# EAGLE design untitled (EAGLE 9.6.2)
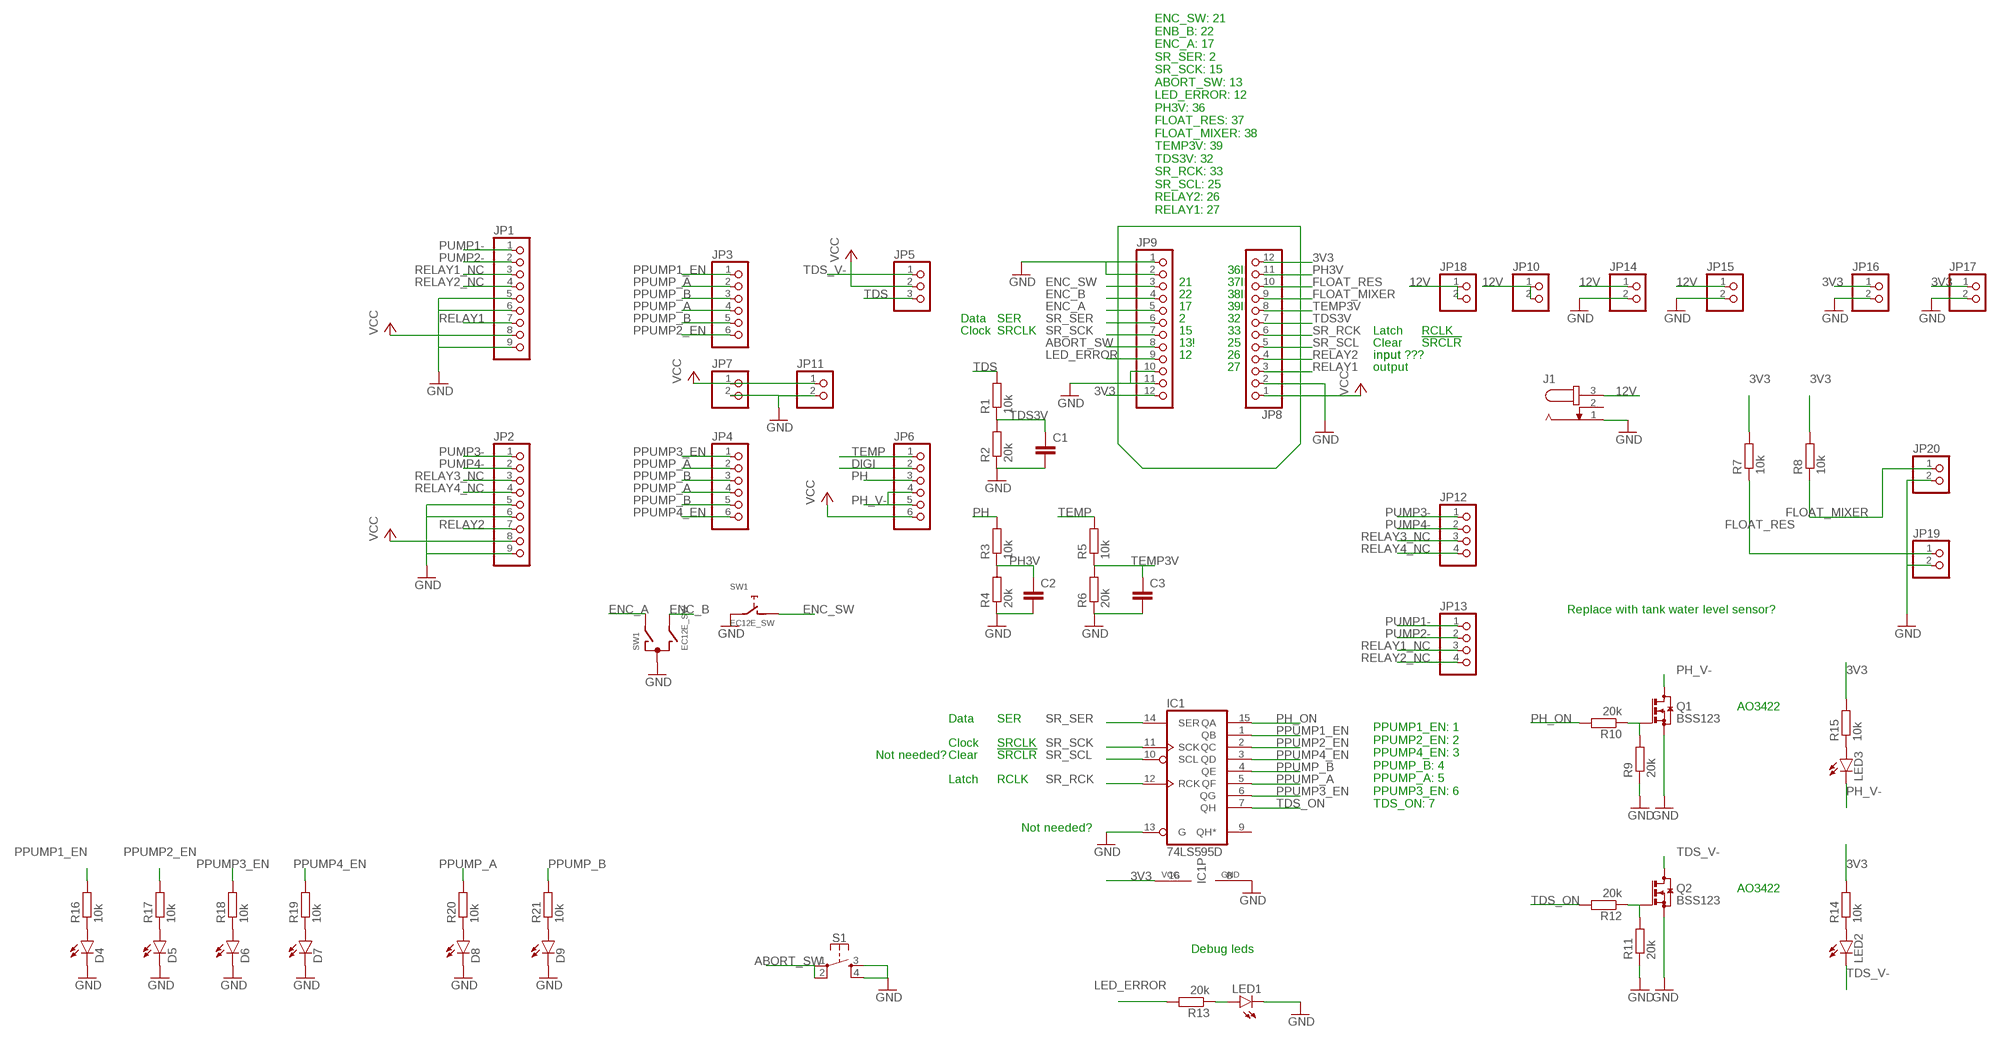
[diagram p0: schematic, sheet 1]

## Parts
C1  C-EUC0805  [C0805]
C2  C-EUC0805  [C0805]
C3  C-EUC0805  [C0805]
D4  LEDCHIP-LED0603  [CHIP-LED0603]
D5  LEDCHIP-LED0603  [CHIP-LED0603]
D6  LEDCHIP-LED0603  [CHIP-LED0603]
D7  LEDCHIP-LED0603  [CHIP-LED0603]
D8  LEDCHIP-LED0603  [CHIP-LED0603]
D9  LEDCHIP-LED0603  [CHIP-LED0603]
IC1  74LS595D  [SO16]
J1  JACK-PLUG1  [SPC4078]
JP1  PINHD-1X9  [1X09]
JP2  PINHD-1X9  [1X09]
JP3  PINHD-1X6  [1X06]
JP4  PINHD-1X6  [1X06]
JP5  PINHD-1X3  [1X03]
JP6  PINHD-1X6  [1X06]
JP7  PINHD-1X2  [1X02]
JP8  PINHD-1X12  [1X12]
JP9  PINHD-1X12  [1X12]
JP10  PINHD-1X2  [1X02]
JP11  PINHD-1X2  [1X02]
JP12  PINHD-1X4  [1X04]
JP13  PINHD-1X4  [1X04]
JP14  PINHD-1X2  [1X02]
JP15  PINHD-1X2  [1X02]
JP16  PINHD-1X2  [1X02]
JP17  PINHD-1X2  [1X02]
JP18  PINHD-1X2  [1X02]
JP19  PINHD-1X2  [1X02]
JP20  PINHD-1X2  [1X02]
LED1  LEDCHIP-LED0603  [CHIP-LED0603]
LED2  LEDCHIP-LED0603  [CHIP-LED0603]
LED3  LEDCHIP-LED0603  [CHIP-LED0603]
Q1  BSS123  [SOT23]
Q2  BSS123  [SOT23]
R1  10k  R-EU_R0805  [R0805]
R2  20k  R-EU_R0805  [R0805]
R3  10k  R-EU_R0805  [R0805]
R4  20k  R-EU_R0805  [R0805]
R5  10k  R-EU_R0805  [R0805]
R6  20k  R-EU_R0805  [R0805]
R7  10k  R-EU_R0805  [R0805]
R8  10k  R-EU_R0805  [R0805]
R9  20k  R-EU_R0805  [R0805]
R10  20k  R-EU_R0805  [R0805]
R11  20k  R-EU_R0805  [R0805]
R12  20k  R-EU_R0805  [R0805]
R13  20k  R-EU_R0805  [R0805]
R14  10k  R-EU_R0805  [R0805]
R15  10k  R-EU_R0805  [R0805]
R16  10k  R-EU_R0805  [R0805]
R17  10k  R-EU_R0805  [R0805]
R18  10k  R-EU_R0805  [R0805]
R19  10k  R-EU_R0805  [R0805]
R20  10k  R-EU_R0805  [R0805]
R21  10k  R-EU_R0805  [R0805]
S1  MOMENTARY-SWITCH-SPST-2-SMD-5.2MM  [TACTILE_SWITCH_SMD_5.2MM]
SW1  EC12E_SW  [ALPS_EC12E_SW]

## Nets
3V3: IC1.16(VCC) JP8.12 JP9.12 JP16.1 JP17.1 R7.2 R8.2 R14.2 R15.2
12V: J1.3 JP10.1 JP10.2 JP14.1 JP15.1 JP18.1 JP18.2
ABORT_SW: JP9.8 S1.1 S1.2
DIGI: JP6.2
ENC_A: JP9.5 SW1.A
ENC_B: JP9.4 SW1.B
ENC_SW: JP9.3 SW1.D
FLOAT_MIXER: JP8.9 JP20.1 R8.1
FLOAT_RES: JP8.10 JP19.1 R7.1
GND: C1.2 C2.2 C3.2 D4.C D5.C D6.C D7.C D8.C D9.C IC1.8(GND) IC1.13(G) J1.1 JP1.5 JP1.6 JP1.9 JP2.5 JP2.6 JP2.9 JP7.2 JP8.2 JP9.1 JP9.2 JP9.10 JP9.11 JP11.2 JP14.2 JP15.2 JP16.2 JP17.2 JP19.2 JP20.2 LED1.C Q1.2(S) Q2.2(S) R2.1 R4.1 R6.1 R9.1 R11.1 S1.3 S1.4 SW1.C SW1.E
LED_ERROR: JP9.9 R13.2
N$1: LED2.A R14.1
N$2: LED1.A R13.1
N$3: LED3.A R15.1
N$4: D4.A R16.1
N$5: D5.A R17.1
N$6: D6.A R18.1
N$7: D7.A R19.1
N$8: D8.A R20.1
N$9: D9.A R21.1
N$10: Q1.1(G) R9.2 R10.1
N$11: Q2.1(G) R11.2 R12.1
PH: JP6.3 R3.2
PH3V: C2.1 JP8.11 R3.1 R4.2
PH_ON: IC1.15(QA) R10.2
PH_V-: JP6.4 JP6.5 LED3.C Q1.3(D)
PPUMP1_EN: IC1.1(QB) JP3.1 R16.2
PPUMP2_EN: IC1.2(QC) JP3.6 R17.2
PPUMP3_EN: IC1.6(QG) JP4.1 R18.2
PPUMP4_EN: IC1.3(QD) JP4.6 R19.2
PPUMP_A: IC1.5(QF) JP3.2 JP3.4 JP4.2 JP4.4 R20.2
PPUMP_B: IC1.4(QE) JP3.3 JP3.5 JP4.3 JP4.5 R21.2
PUMP1-: JP1.1 JP13.1
PUMP2-: JP1.2 JP13.2
PUMP3-: JP2.1 JP12.1
PUMP4-: JP2.2 JP12.2
RELAY1: JP1.7 JP8.3
RELAY1_NC: JP1.3 JP13.3
RELAY2: JP2.7 JP8.4
RELAY2_NC: JP1.4 JP13.4
RELAY3_NC: JP2.3 JP12.3
RELAY4_NC: JP2.4 JP12.4
SR_RCK: IC1.12(RCK) JP8.6
SR_SCK: IC1.11(SCK) JP9.7
SR_SCL: IC1.10(SCL) JP8.5
SR_SER: IC1.14(SER) JP9.6
TDS: JP5.3 R1.2
TDS3V: C1.1 JP8.7 R1.1 R2.2
TDS_ON: IC1.7(QH) R12.2
TDS_V-: JP5.1 LED2.C Q2.3(D)
TEMP: JP6.1 R5.2
TEMP3V: C3.1 JP8.8 R5.1 R6.2
VCC: JP1.8 JP2.8 JP5.2 JP6.6 JP7.1 JP8.1 JP11.1
Unconnected: IC1.9(QH*) J1.2 SW1.GND1(G) SW1.GND2(G)

## Notes on the sheet
- ENC_SW: 21
  ENB_B: 22
  ENC_A: 17
  SR_SER: 2
  SR_SCK: 15
  ABORT_SW: 13
  LED_ERROR: 12
  PH3V: 36
  FLOAT_RES: 37
  FLOAT_MIXER: 38
  TEMP3V: 39
  TDS3V: 32
  SR_RCK: 33
  SR_SCL: 25
  RELAY2: 26
  RELAY1: 27
- 36I
- 21 | 37I
- 22 | 38I
- 17 | 39I
- Data | SER | 2 | 32
- Clock | SRCLK | 15 | 33 | Latch | RCLK
- 13! | 25 | Clear | !SRCLR
- 12 | 26 | input | input ???
- 27 | output
- Replace with tank water level sensor?
- AO3422
- Data | SER
- Clock | SRCLK
- Not needed? | Clear | !SRCLR
- Latch | RCLK
- PPUMP1_EN: 1
  PPUMP2_EN: 2
  PPUMP4_EN: 3
  PPUMP_B: 4
  PPUMP_A: 5
  PPUMP3_EN: 6
  TDS_ON: 7
- Not needed?
- AO3422
- Debug leds

## Library data of the parts
C1-C3 = rcl:C-EU: CAPACITOR, European symbol; SPICEPREFIX: C
D4-D9 LED1-LED3 = led:LED: LED OSRAM: - CHIPLED LG R971, LG N971, LY N971, LG Q971, LY Q971, LO R971, LY R971 LH N974, LH R974 LS Q976, LO Q976, LY Q976 LO Q996 - Hyper CHIPLED LW Q18S LB Q993, LB Q99A, LB R99A - SideLED LS A670, LO A670, LY A670, LG A670, LP A670 LB A673, LV A673, LT A673, LW A673 LH A674 LY A675 LS A676, LA A676, LO A676, LY A676, LW A676 LS A679, LY A679, LG A679 - Hyper Micro SIDELED® LS Y876, LA Y876, LO Y876, LY Y876 LT Y87S - SmartLED LW L88C, LW L88S LB L89C, LB L89S, LG L890 LS L89K, LO L89K, LY L89K LS L896, LA L896, LO L896, LY L896 - TOPLED LS T670, LO T670, LY T670, LG T670, LP T670 LSG T670, LSP T670, LSY T670, LOP T670, LYG T670 LG T671, LOG T671, LSG T671 LB T673, LV T673, LT T673, LW T673 LH T674 LS T676, LA T676, LO T676, LY T676, LB T676, LH T676, LSB T676, LW T676 LB T67C, LV T67C, LT T67C, LS T67K, LO T67K, LY T67K, LW E67C LS E67B, LA E67B, LO E67B, LY E67B, LB E67C, LV E67C, LT E67C LW T67C LS T679, LY T679, LG T679 LS T770, LO T770, LY T770, LG T770, LP T770 LB T773, LV T773, LT T773, LW T773 LH T774 LS E675, LA E675, LY E675, LS T675 LS T776, LA T776, LO T776, LY T776, LB T776 LHGB T686 LT T68C, LB T68C - Hyper Mini TOPLED® LB M676 - Mini TOPLED Santana® LG M470 LS M47K, LO M47K, LY M47K Source: http://www.osram.convergy.de LUXEON: - LUMILED® LXK2-PW12-R00, LXK2-PW12-S00, LXK2-PW14-U00, LXK2-PW14-V00 LXK2-PM12-R00, LXK2-PM12-S00, LXK2-PM14-U00 LXK2-PE12-Q00, LXK2-PE12-R00, LXK2-PE12-S00, LXK2-PE14-T00, LXK2-PE14-U00 LXK2-PB12-K00, LXK2-PB12-L00, LXK2-PB12-M00, LXK2-PB14-N00, LXK2-PB14-P00, LXK2-PB14-Q00 LXK2-PR12-L00, LXK2-PR12-M00, LXK2-PR14-Q00, LXK2-PR14-R00 LXK2-PD12-Q00, LXK2-PD12-R00, LXK2-PD12-S00 LXK2-PH12-R00, LXK2-PH12-S00 LXK2-PL12-P00, LXK2-PL12-Q00, LXK2-PL12-R00 Source: www.luxeon.com KINGBRIGHT: KA-3528ASYC Source: www.kingbright.com
IC1 = 74xx-us:74*595: 8-bit SHIFT REGISTER, output latch
J1 = con-jack:JACK-PLUG: DC POWER JACK Power Jack, DC, Right Angle, Through Hole, Rated 5A at 16VDC, PC Terminals Distributor: Farnell (www.Farnell.de) Drawing: 84N1161.pdf / 84N1162.pdf Manufacturer: SPC Technology (www.spctechnology.com) Type: SPC4077 / SPC 4078; OC_FARNELL: unknown; OC_NEWARK: unknown
JP1 JP2 = pinhead:PINHD-1X9: PIN HEADER
JP3 JP4 JP6 = pinhead:PINHD-1X6: PIN HEADER
JP5 = pinhead:PINHD-1X3: PIN HEADER
JP7 JP10 JP11 JP14-JP20 = pinhead:PINHD-1X2: PIN HEADER
JP8 JP9 = pinhead:PINHD-1X12: PIN HEADER
JP12 JP13 = pinhead:PINHD-1X4: PIN HEADER
Q1 Q2 = transistor-small-signal:BSS123: N-CHANNEL MOS FET
R1-R21 = rcl:R-EU_: RESISTOR, European symbol; SPICEPREFIX: R
S1 = SparkFun-Switches:MOMENTARY-SWITCH-SPST-2: Momentary Switch (Pushbutton) - SPST - Two Circuits Normally-open (NO) SPST momentary switches (buttons, pushbuttons). Schematic symbol includes two switch circuits. Variants SMD-4.6MMX2.8MM - 4.60mm x 2.80mm Tactile Momentary Button Switch - Used on SparkFun SAMD21 Mini Breakout <https://www.sparkfun.com/products/13664> SMD-5.2MM - Mini Pushbutton Switch - SMD <https://www.sparkfun.com/products/8720> - Used on Arduino Pro Mini <https://www.sparkfun.com/products/11114>; PROD_ID: SWCH-08247; SF_SKU: COM-08720
SW1 = switch-alps:EC12E_SW: ALPS rotary Encoder EC12E series with switch; MPN: EC12E2424407; OC_FARNELL: 1520813; OC_NEWARK: 74M1068

## Board
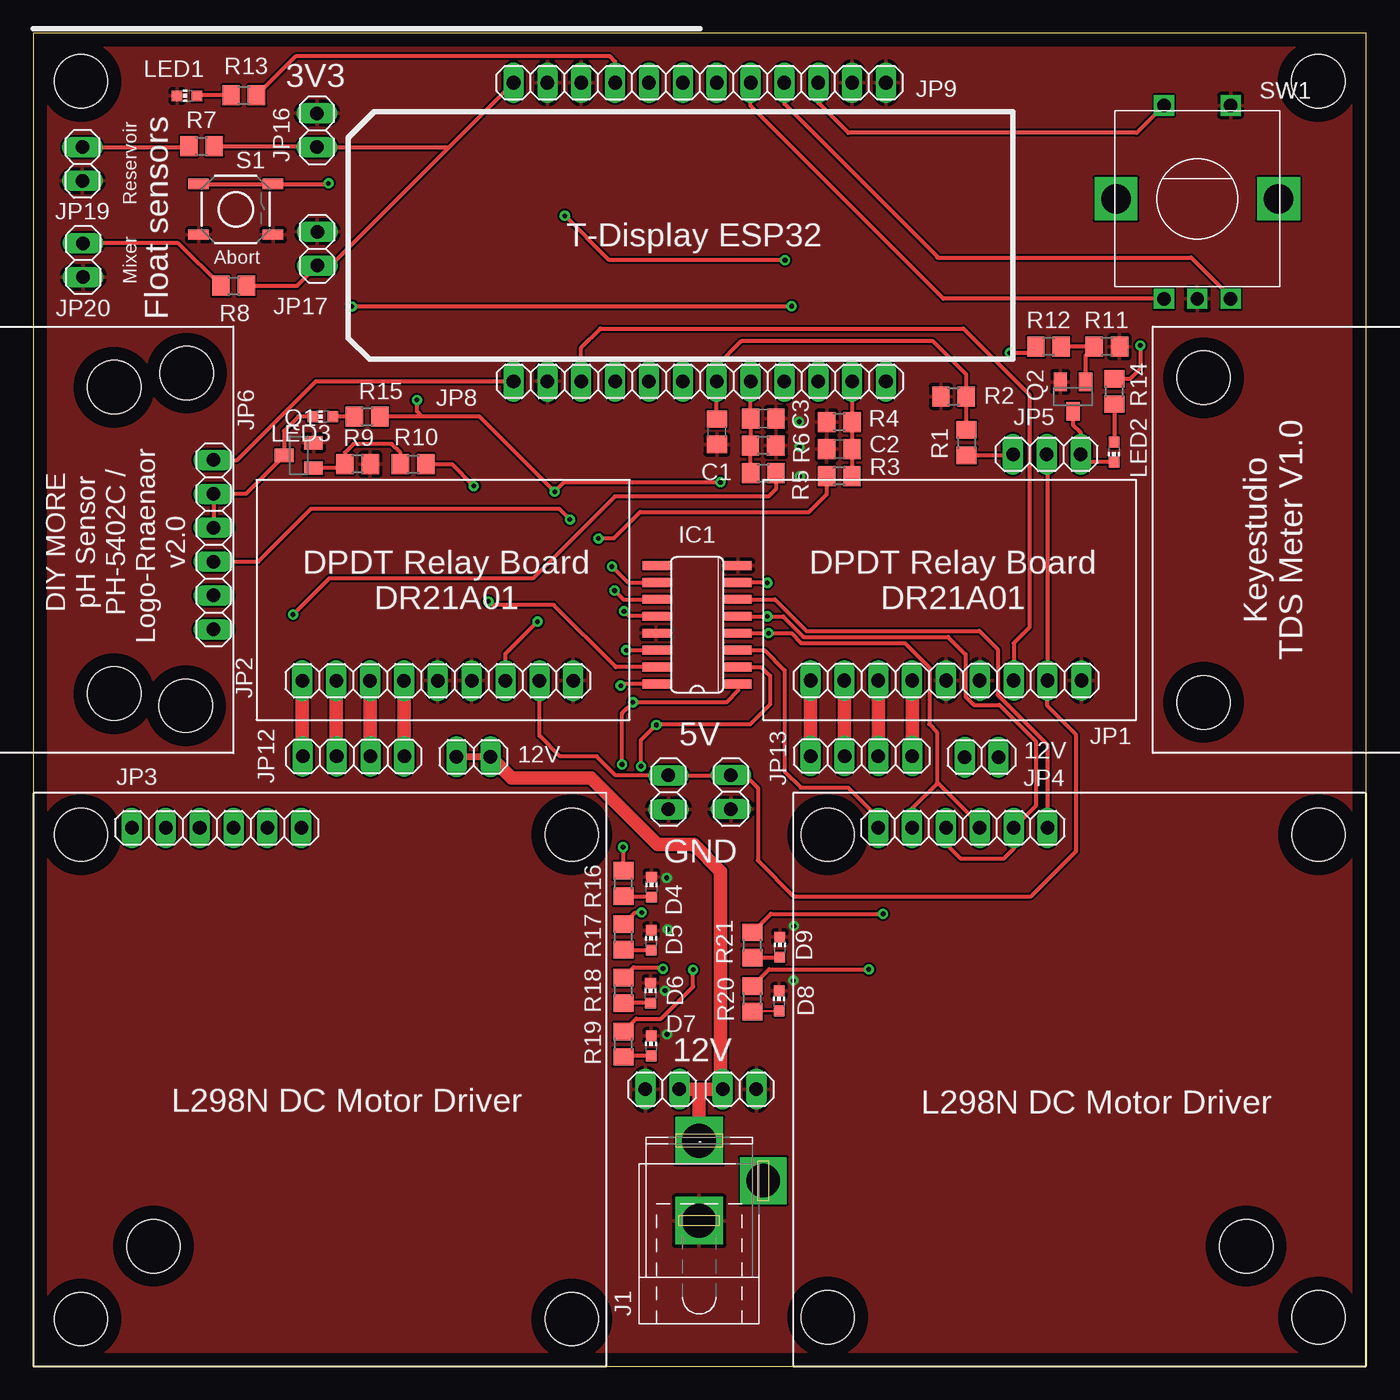
[diagram p1: board, top side]
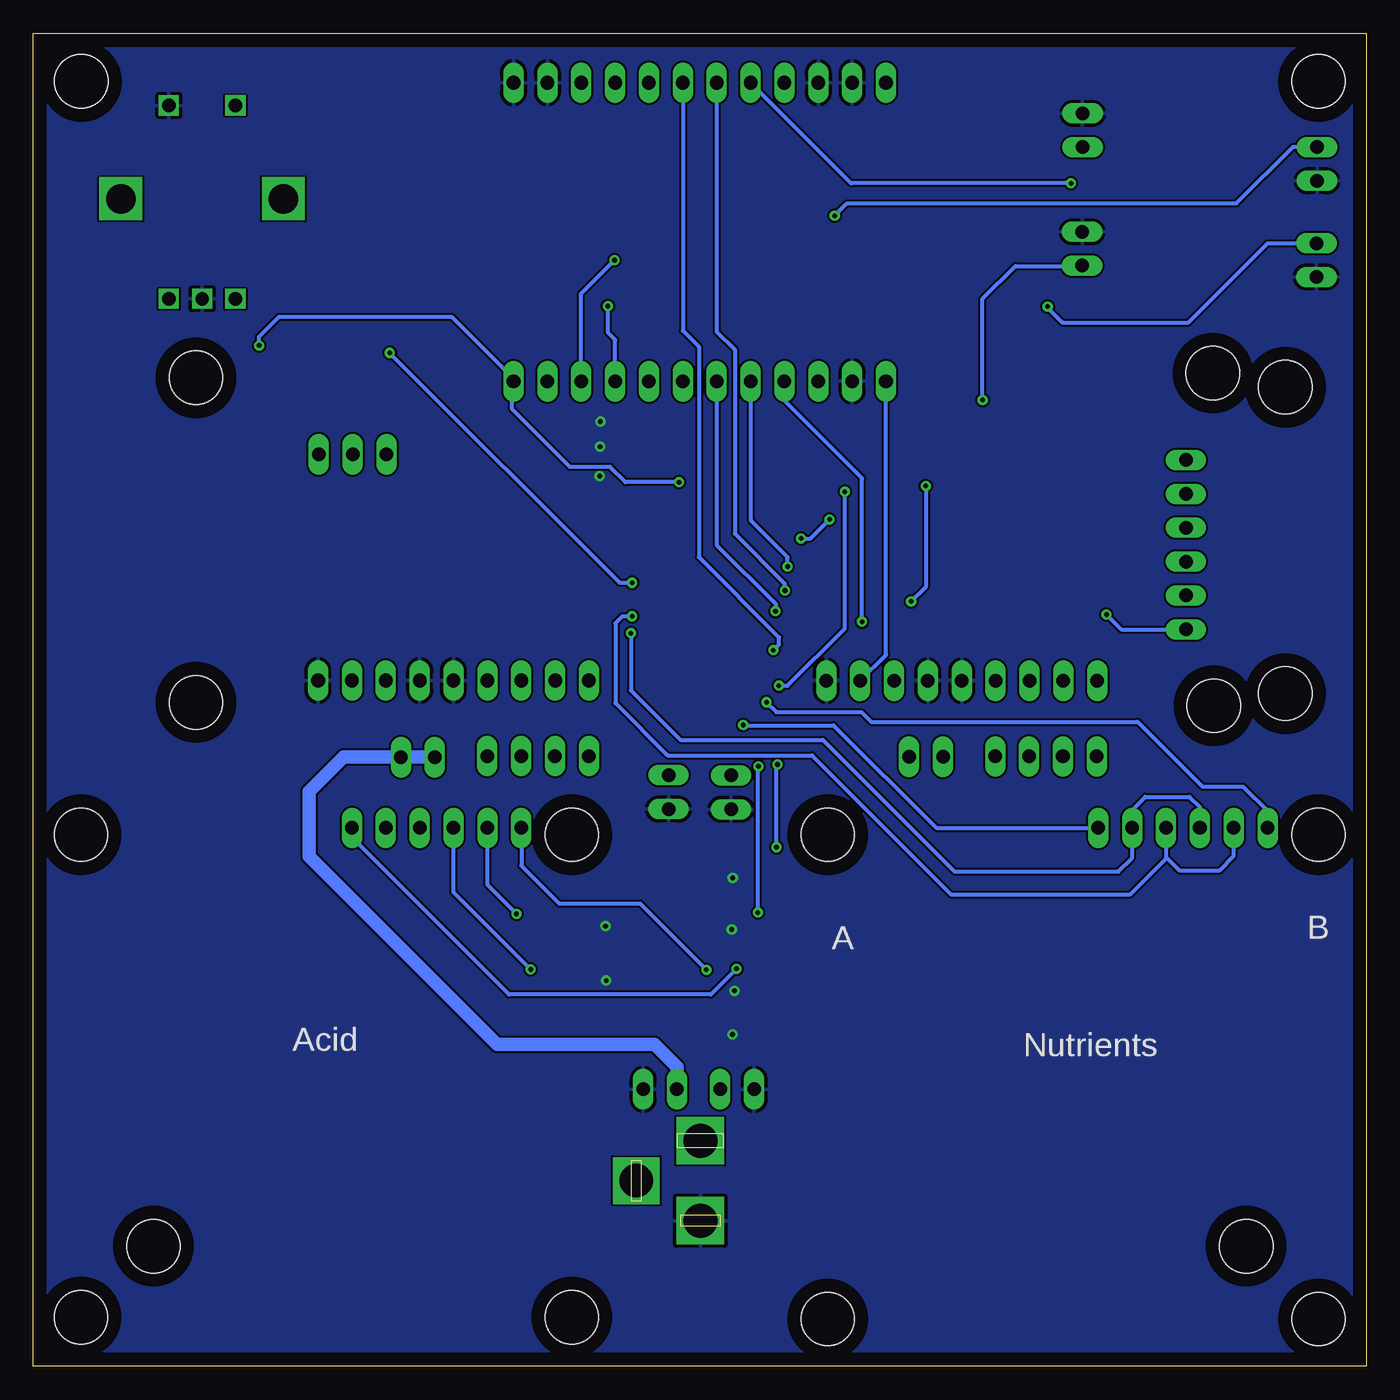
[diagram p2: board, bottom side, seen from below]

Size 100 x 100 mm. Coordinates in mm from the lower left corner, seen from the top.
Outline: 0,0 100,0 100,100 0,100 0,0
Copper layers (1*16): Top 0.035mm / dielectric 1.5mm / Bottom 0.035mm
Design rules "default": minimum track width 6mil, minimum drill 0.35mm, track to track 6mil, track to pad 6mil, pad to pad 6mil, via to via 6mil, smd to smd 6mil, copper to edge 40mil, drill to drill 6mil, minimum pad ring 10mil, minimum via ring 8mil, stop-mask expansion 4mil, vias tented up to drill 0mil, thermal gap 10mil
Holes 4 mm at 11.43,49.55 11.51,74.51 3.57,39.89 40.4,39.89 40.4,3.55 3.57,3.55 59.6,3.67 59.59,39.89 96.43,39.89 96.43,3.67 87.81,49.8 87.81,74.17 91,9 9,9 96.4,96.4 3.57,96.4 6.07,50.46 6.07,73.45

### Footprints (pad centres in the part's own frame; a part is rotated, then mirrored left to right if it is on the bottom)
C0805 = smd 1.3 x 1.5: 1 -0.95,0; 2 0.95,0
CHIP-LED0603 = smd 0.8 x 0.8: A 0,-0.75; C 0,0.75
SO16 = smd 0.66 x 2.032: 1 -4.445,-3.073; 2 -3.175,-3.073; 3 -1.905,-3.073; 4 -0.635,-3.073; 5 0.635,-3.073; 6 1.905,-3.073; 7 3.175,-3.073; 8 4.445,-3.073; 9 4.445,3.073; 10 3.175,3.073; 11 1.905,3.073; 12 0.635,3.073; 13 -0.635,3.073; 14 -1.905,3.073; 15 -3.175,3.073; 16 -4.445,3.073
SPC4078 = drill 2.55 pad 3 square: 1 -3,0; 3 3,0 | drill 2.5 pad 3 square: 2 0,-4.8
1X09 = drill 1.016 long: 1 -10.16,0; 2 -7.62,0; 3 -5.08,0; 4 -2.54,0; 5 0,0; 6 2.54,0; 7 5.08,0; 8 7.62,0; 9 10.16,0
1X06 = drill 1.016 long: 1 -6.35,0; 2 -3.81,0; 3 -1.27,0; 4 1.27,0; 5 3.81,0; 6 6.35,0
1X03 = drill 1.016 long: 1 -2.54,0; 2 0,0; 3 2.54,0
1X02 = drill 1.016 long: 1 -1.27,0; 2 1.27,0
1X12 = drill 1.016 long: 1 -13.97,0; 2 -11.43,0; 3 -8.89,0; 4 -6.35,0; 5 -3.81,0; 6 -1.27,0; 7 1.27,0; 8 3.81,0; 9 6.35,0; 10 8.89,0; 11 11.43,0; 12 13.97,0
1X04 = drill 1.016 long: 1 -3.81,0; 2 -1.27,0; 3 1.27,0; 4 3.81,0
SOT23 = smd 1 x 1.4: 1 -0.95,-1.1; 2 0.95,-1.1; 3 0,1.1
R0805 = smd 1.3 x 1.5: 1 -0.95,0; 2 0.95,0
TACTILE_SWITCH_SMD_5.2MM = smd 1.524 x 0.762: 1 -2.794,1.905; 2 2.794,1.905; 3 -2.794,-1.905; 4 2.794,-1.905
ALPS_EC12E_SW = drill 1 square: A -2.5,-7.5; B 2.5,-7.5; C 0,-7.5; D -2.5,7; E 2.5,7 | drill 2.2 square: GND1 -6.1,0; GND2 6.1,0

### Placement (x,y rotation side)
C1  51.28,70.1 270 top
C2  60.47,68.81 180 top
C3  54.77,71.09 0 top
D4  46.38,35.94 0 top
D5  46.35,31.95 0 top
D6  46.3,27.99 0 top
D7  46.35,24.03 0 top
D8  55.96,27.41 0 top
D9  56.01,31.45 0 top
IC1  49.81,55.63 90 top
J1  49.96,13.92 90 top
JP1  68.47,51.44 0 top
JP2  30.35,51.43 0 top
JP3  13.75,40.39 0 top
JP4  69.74,40.39 180 top
JP5  76.04,68.41 180 top
JP6  13.53,61.64 90 top
JP7  52.34,43.07 270 top
JP8  50,73.89 0 top
JP9  50,96.29 180 top
JP10  71.15,45.69 0 top
JP11  47.65,43.05 270 top
JP12  24.03,45.75 0 top
JP13  62.13,45.78 0 top
JP14  52.98,20.78 0 top
JP15  47.19,20.78 180 top
JP16  21.28,92.73 90 top
JP17  21.31,83.84 90 top
JP18  33.02,45.72 0 top
JP19  3.68,90.2 270 top
JP20  3.73,82.98 270 top
LED1  11.53,95.3 90 top
LED2  81.08,68.58 180 top
LED3  21.72,71.25 90 top
Q1  19.91,68.33 90 top
Q2  78,72.75 180 top
R1  70.02,69.29 270 top
R2  69.05,72.76 0 top
R3  60.47,66.77 180 top
R4  60.48,70.85 0 top
R5  54.76,67.01 0 top
R6  54.76,69.07 180 top
R7  12.62,91.54 0 top
R8  15.04,81.05 0 top
R9  24.33,67.67 180 top
R10  28.5,67.67 0 top
R11  80.54,76.48 180 top
R12  76.17,76.48 180 top
R13  15.8,95.35 0 top
R14  81.1,73.13 90 top
R15  25.04,71.25 0 top
R16  44.27,36.22 90 top
R17  44.27,32.21 90 top
R18  44.27,28.19 90 top
R19  44.27,24.16 90 top
R20  53.95,27.56 90 top
R21  53.95,31.6 90 top
S1  15.19,86.79 0 top
SW1  87.33,87.58 0 top

### Tracks (layer width: path | path; a pad name or v marks a point on that pad's centre or on a via)
3V3  (via drill 0.35, 0.35 pad 0.15)
  Top 0.152: 16.14,80.9 R8.2
  Top 0.305: 13.7,91.42 R7.2 21.32,91.54 21.34,91.52 JP16.1 31.2,91.46 | 31.2,91.46 JP9.12 | R8.2 19.79,81.05 JP17.1 22.31,82.57 31.2,91.46 | v83.06,76.58 83.06,74.84 82.3,74.08 R14.2 | IC1.16 44.2,51.18 v44.07,51.05 | 29.18,71.25 33.48,71.25 v39.12,65.61 39.83,66.32 v51.56,66.32 | 29.18,71.25 R15.2 | 29.18,71.25 28.78,71.65 v28.78,72.49
  Bottom 0.305: v83.06,76.58 83.06,77.24 81.56,78.74 68.61,78.74 64.11,74.24 | 64.11,74.24 63.97,74.11 JP8.12 | v44.07,51.05 43.41,51.05 39.12,55.35 v39.12,65.61 | JP17.1 21.33,82.55 26.31,82.55 28.78,80.09 v28.78,72.49 | 64.11,74.24 64.11,71.86 59.71,67.46 56.72,67.46 55.57,66.32 v51.56,66.32
12V
  Top 0.508: JP18.2 JP18.1
  Top 1.016: 49.96,18.63 J1.3 49.96,20.68 49.94,20.7 | JP18.2 35.87,44.15 41.83,44.15 46.83,39.14 49.55,39.14 51.56,37.13 51.56,20.93 JP14.1 49.99,20.78 49.94,20.73 49.94,20.7 | 49.94,20.7 49.86,20.78 JP15.1
  Bottom 1.016: JP10.1 JP10.2 76.73,45.7 79.3,43.13 79.3,38.23 65.2,24.13 53.39,24.13 51.71,22.45 JP14.1
ABORT_SW  (via drill 0.35)
  Top 0.305: S1.1 S1.2 22.1,88.7 v22.15,88.75
  Bottom 0.305: v22.15,88.75 38.65,88.75 JP9.8
ENC_A
  Top 0.305: SW1.A 68.28,80.08 53.81,94.55 JP9.5
ENC_B
  Top 0.152: 67.82,83.24 67.82,83.19
  Top 0.305: 67.82,83.19 86.87,83.19 89.83,80.22 SW1.B | JP9.4 56.35,94.7 67.82,83.24
ENC_SW
  Top 0.305: SW1.D 82.78,92.53 61.14,92.53 58.89,94.78 JP9.3
FLOAT_MIXER  (via drill 0.35)
  Top 0.305: R8.1 10.89,84.25 JP20.1 | v56.9,79.53 56.87,79.5 v23.9,79.5
  Bottom 0.305: JP8.9 56.35,77 56.9,77.55 v56.9,79.53 | v23.9,79.5 23.9,79.43 22.78,78.31 13.34,78.31 7.39,84.25 JP20.1
FLOAT_RES  (via drill 0.35)
  Top 0.152: 11.6,91.47 R7.1
  Top 0.305: JP19.1 11.6,91.47 | v56.39,82.98 43.2,82.98 v39.88,86.31
  Bottom 0.305: JP8.10 58.89,80.48 v56.39,82.98 | v39.88,86.31 38.94,87.25 9.73,87.25 5.49,91.49 3.71,91.49 JP19.1
GND  (via drill 0.35, 0.35 pad 0.15)
  other vias: 57.45,70.87 57.48,68.99 57.51,66.78 57.07,33.02 57.02,28.93 47.4,28.17 47.6,32.77 47.52,36.63 47.55,24.89
  pour Top: 0,100 100,100 100,0 0,0
  pour Bottom: 0,100 100,100 100,0 0,0
LED_ERROR
  Top 0.305: JP9.9 43.65,97.88 43.26,98.27 19.67,98.27 R13.2
N$1
  Top 0.305: R14.1 81.1,69.36 LED2.A
N$2
  Top 0.305: R13.1 12.33,95.35 LED1.A
N$3
  Top 0.305: R15.1 LED3.A
N$4
  Top 0.165: 44.35,35.19 R16.1
  Top 0.305: D4.A 44.35,35.19
N$5
  Top 0.165: 44.33,31.2 R17.1
  Top 0.305: D5.A 44.33,31.2
N$6
  Top 0.165: R18.1
  Top 0.305: D6.A R18.1
N$7
  Top 0.165: 44.34,23.28 R19.1
  Top 0.305: D7.A 44.34,23.28
N$8
  Top 0.165: D8.A 55.91,26.61 R20.1
N$9
  Top 0.165: D9.A 55.96,30.65
  Top 0.305: 55.96,30.65 R21.1
N$10
  Top 0.305: R10.1 27.55,68.54 26.9,69.19 24.03,69.19 23.38,68.54 R9.2 23.09,67.38 Q1.1
N$11
  Top 0.305: Q2.1 78.95,75.84 R11.2 R12.1
PH  (via drill 0.35)
  Top 0.305: JP6.3 16.87,60.37 20.84,64.34 39.45,64.34 v40.26,63.52 | v42.39,62.1 43.54,62.1 45.53,64.1 58.21,64.1 59.52,65.41 R3.2
  Bottom 0.305: v42.39,62.1 41.68,62.1 v40.26,63.52
PH3V
  Top 0.305: JP8.11 R4.2 C2.1 R3.1
PH_ON  (via drill 0.35)
  Top 0.305: IC1.15 43.71,52.45 39.04,57.12 34.39,57.12 v34.14,57.38 | R10.2 31.42,67.67 v33.05,66.04
  Bottom 0.305: v33.05,66.04 33.05,58.47 v34.14,57.38
PH_V-
  Top 0.305: LED3.C 19.89,71.25 18.81,70.17 Q1.3 15.93,65.45 JP6.5 JP6.4
PPUMP1_EN  (via drill 0.35, 0.35 pad 0.15)
  Top 0.305: IC1.1 52.88,50.7 51.99,49.81 v44.98,49.81 44.17,49 v44.17,45.14 | R16.2 44.27,38.91 v44.25,38.94
  Bottom 0.305: v44.98,49.81 44.25,49.07 37.87,49.07 37.13,48.34 17.14,48.34 12.29,43.48 9.25,43.48 7.4,41.64 JP3.1 | v44.25,38.94 44.25,45.06 v44.17,45.14
PPUMP2_EN  (via drill 0.35, 0.35 pad 0.15)
  Top 0.305: IC1.2 54.61,52.45 55.27,51.79 55.27,49.66 53.77,48.16 46.79,48.16 v46.74,48.11 45.59,46.97 v45.59,45.01 | R17.2 45.15,34.04 v45.64,34.04
  Bottom 0.305: v46.74,48.11 46.71,48.08 39.95,48.08 32.26,40.39 JP3.6 | v45.64,34.04 45.64,44.95 v45.59,45.01
PPUMP3_EN  (via drill 0.35 pad 0.15)
  Top 0.305: IC1.6 55.63,57.53 57.99,55.17 70.97,55.17 72.36,53.78 72.36,50.37 76.09,46.63 JP4.1 | R18.2 45.05,29.92 47.14,29.92 v47.24,29.82
  Bottom 0.305: v47.24,29.82 49.17,27.89 64.31,27.89 76.09,39.67 JP4.1
PPUMP4_EN  (via drill 0.35 pad 0.15)
  Top 0.305: IC1.3 54.84,53.72 56.36,52.2 56.36,44.63 57.58,43.41 61.11,43.41 63.39,41.13 JP4.6 | R19.2 45.23,26.06 47.09,26.06 49.51,28.47 v49.51,29.74
  Bottom 0.305: v49.51,29.74 54.46,34.7 60.53,34.7 63.37,37.54 63.37,40.37 JP4.6
PPUMP_A  (via drill 0.35, 0.35 pad 0.15)
  Top 0.305: JP4.4 68.47,39.2 69.6,38.08 72.77,38.08 73.55,38.85 JP4.2 75.2,42.04 75.2,46.88 72.47,49.62 70.57,49.62 69.95,50.24 69.95,53.4 68.63,54.71 57.8,54.71 56.25,56.26 v55.07,56.26 IC1.5 | R20.2 55.21,29.77 v62.69,29.77
  Bottom 0.305: v55.07,56.26 55.83,56.26 56.33,55.76 56.33,49.74 52.41,45.82 41.57,45.82 31.16,35.41 17.7,35.41 15.01,38.1 15.01,40.38 JP3.4 15.02,38.21 14.02,37.21 11,37.21 9.94,38.27 JP3.2 | v62.69,29.77 68.47,35.55 JP4.4
PPUMP_B  (via drill 0.35, 0.35 pad 0.15)
  Top 0.305: 67.79,43.69 67.79,47.6 67.23,48.16 67.23,52.42 65.39,54.25 57.61,54.25 56.87,54.99 v55.17,54.99 IC1.4 | JP4.3 71.01,40.61 67.86,43.76 67.79,43.69 | 67.79,43.69 65.93,41.83 JP4.5 | R21.2 55.34,33.93 v63.75,33.93
  Bottom 0.305: v55.17,54.99 55.17,50.7 51.46,46.99 40.77,46.99 30.89,37.11 18.59,37.11 17.56,38.14 JP3.5 17.56,41.75 16.59,42.72 13.26,42.72 12.48,41.94 JP3.3 | v63.75,33.93 65.93,36.11 JP4.5
PUMP1-
  Top 1: JP1.1 JP13.1
PUMP2-
  Top 1: JP1.2 JP13.2
PUMP3-
  Top 1: JP2.1 20.19,45.77 JP12.1
PUMP4-
  Top 1: JP2.2 22.73,45.77 JP12.2
RELAY1
  Top 0.305: JP8.3 41.11,76.42 42.55,77.85 69.77,77.85 74.72,72.91 74.72,55.41 73.55,54.25 JP1.7
RELAY1_NC
  Top 1: JP1.3 JP13.3
RELAY2  (via drill 0.35)
  Top 0.305: JP2.7 35.43,53.46 v37.82,55.85
  Bottom 0.305: v37.82,55.85 37.82,66.62 43.65,72.45 JP8.4
RELAY2_NC
  Top 1: JP1.4 65.94,51.43 JP13.4
RELAY3_NC
  Top 1: JP2.3 25.27,45.77 JP12.3
RELAY4_NC
  Top 1: JP2.4 27.81,45.77 JP12.4
SR_RCK  (via drill 0.35)
  Top 0.305: IC1.12 46.71,56.29 44.68,56.29 v44.32,56.64
  Bottom 0.305: JP8.6 48.73,61.61 44.3,57.17 44.3,56.67 v44.32,56.64
SR_SCK  (via drill 0.35)
  Top 0.305: v43.61,58.19 44.27,57.53 IC1.11
  Bottom 0.305: JP9.7 48.73,77.61 47.37,76.25 47.37,62.46 43.64,58.73 43.64,58.22 v43.61,58.19
SR_SCL  (via drill 0.35)
  Top 0.305: v43.41,59.99 44.6,58.8 IC1.10
  Bottom 0.305: JP8.5 46.19,63.49 43.41,60.71 v43.41,59.99
SR_SER  (via drill 0.35)
  Top 0.305: v44.48,53.72 IC1.14
  Bottom 0.305: JP9.6 51.27,77.69 50.06,76.48 50.06,60.71 44.04,54.69 44.04,54.15 v44.48,53.72
TDS
  Top 0.254: 73.45,68.37 JP5.3
  Top 0.305: R1.2 73.45,68.37
TDS3V
  Top 0.254: 51.27,74.09 JP8.7 | C1.1 51.27,71.06
  Top 0.305: 51.27,74.09 51.27,75.05 53.11,76.89 67.51,76.89 70,74.4 R2.2 70.02,72.74 R1.1 | 51.27,71.06 JP8.7
TDS_ON  (via drill 0.35)
  Top 0.305: R12.2 74.77,76.02 v73.25,76.02 | v55.07,58.78 52.91,58.78 IC1.7
  Bottom 0.305: v73.25,76.02 56.01,58.78 v55.07,58.78
TDS_V-
  Top 0.305: Q2.3 78,70.61 78.58,70.04 JP5.1 79.16,67.83 LED2.C
TEMP  (via drill 0.35)
  Top 0.305: R5.2 55.72,65.8 55.17,65.25 43.64,65.25 37.49,59.11 22.2,59.11 v19.48,56.39
  Bottom 0.305: 19.46,56.36 v19.48,56.39 18.38,55.29 JP6.1
TEMP3V
  Top 0.305: R5.1 R6.2 C3.1 JP8.8
VCC
  Top 0.254: JP5.2 76.09,68.35
  Top 0.305: 76.09,68.35 JP1.8 76.09,49.51 78.25,47.35 78.25,38.65 74.86,35.26 57.04,35.26 54.36,37.95 54.36,43.37 53.38,44.34 JP7.1 52.32,44.32 JP11.1 43.69,44.32 42.27,45.74 39.52,45.74 37.97,47.3 JP2.8 | JP6.6 15.3,67.99 21.21,73.89 JP8.1
  Bottom 0.305: JP2.8 36.03,53.37 JP8.1

### Text on the board
tPlace: 3V3 | Float sensors | Reservoir | Mixer | Abort
tNames: T-Display ESP32 | DIY MORE / pH Sensor / PH-5402C / / Logo-Rnaenaor / v2.0 | Keyestudio / TDS Meter V1.0 | DPDT Relay Board / DR21A01 | DPDT Relay Board / DR21A01 | 5V | 12V | 12V | GND | 12V | L298N DC Motor Driver | L298N DC Motor Driver
bNames: B | A | Acid | Nutrients
Document: Siirrä liitintä ylöspäin